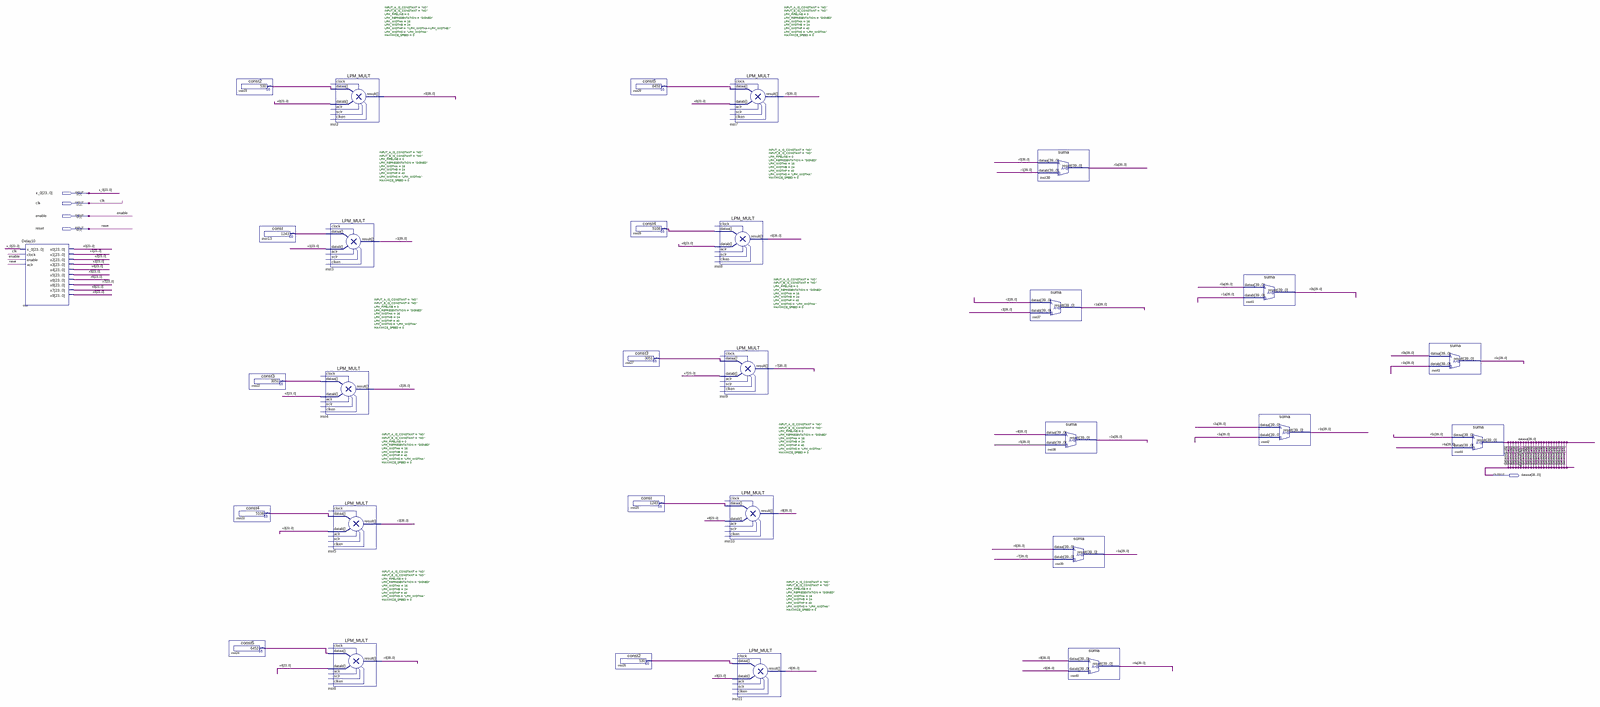
[diagram p0: schematic sheet, whole]
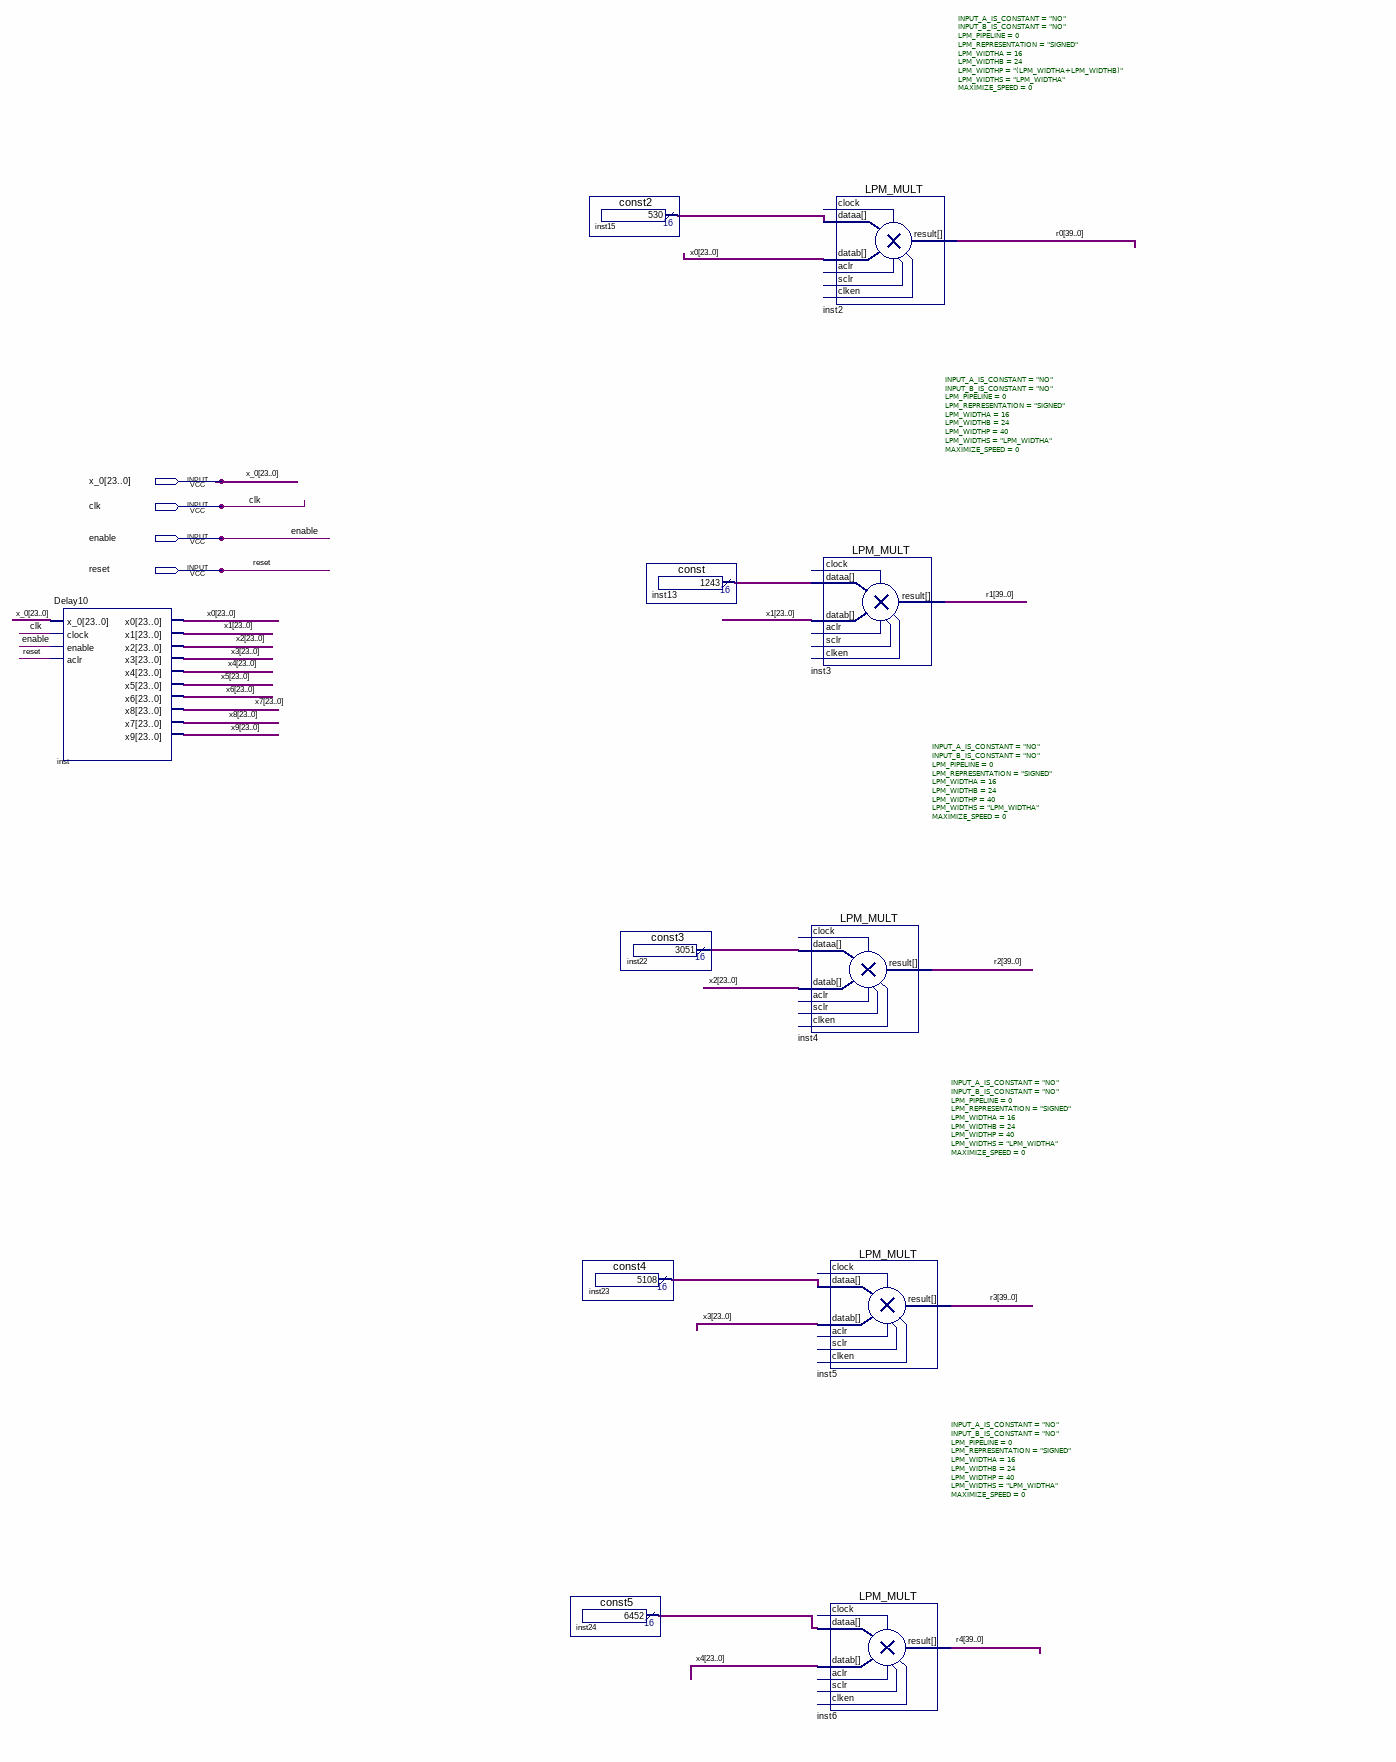
[diagram p1: schematic sheet, left part]
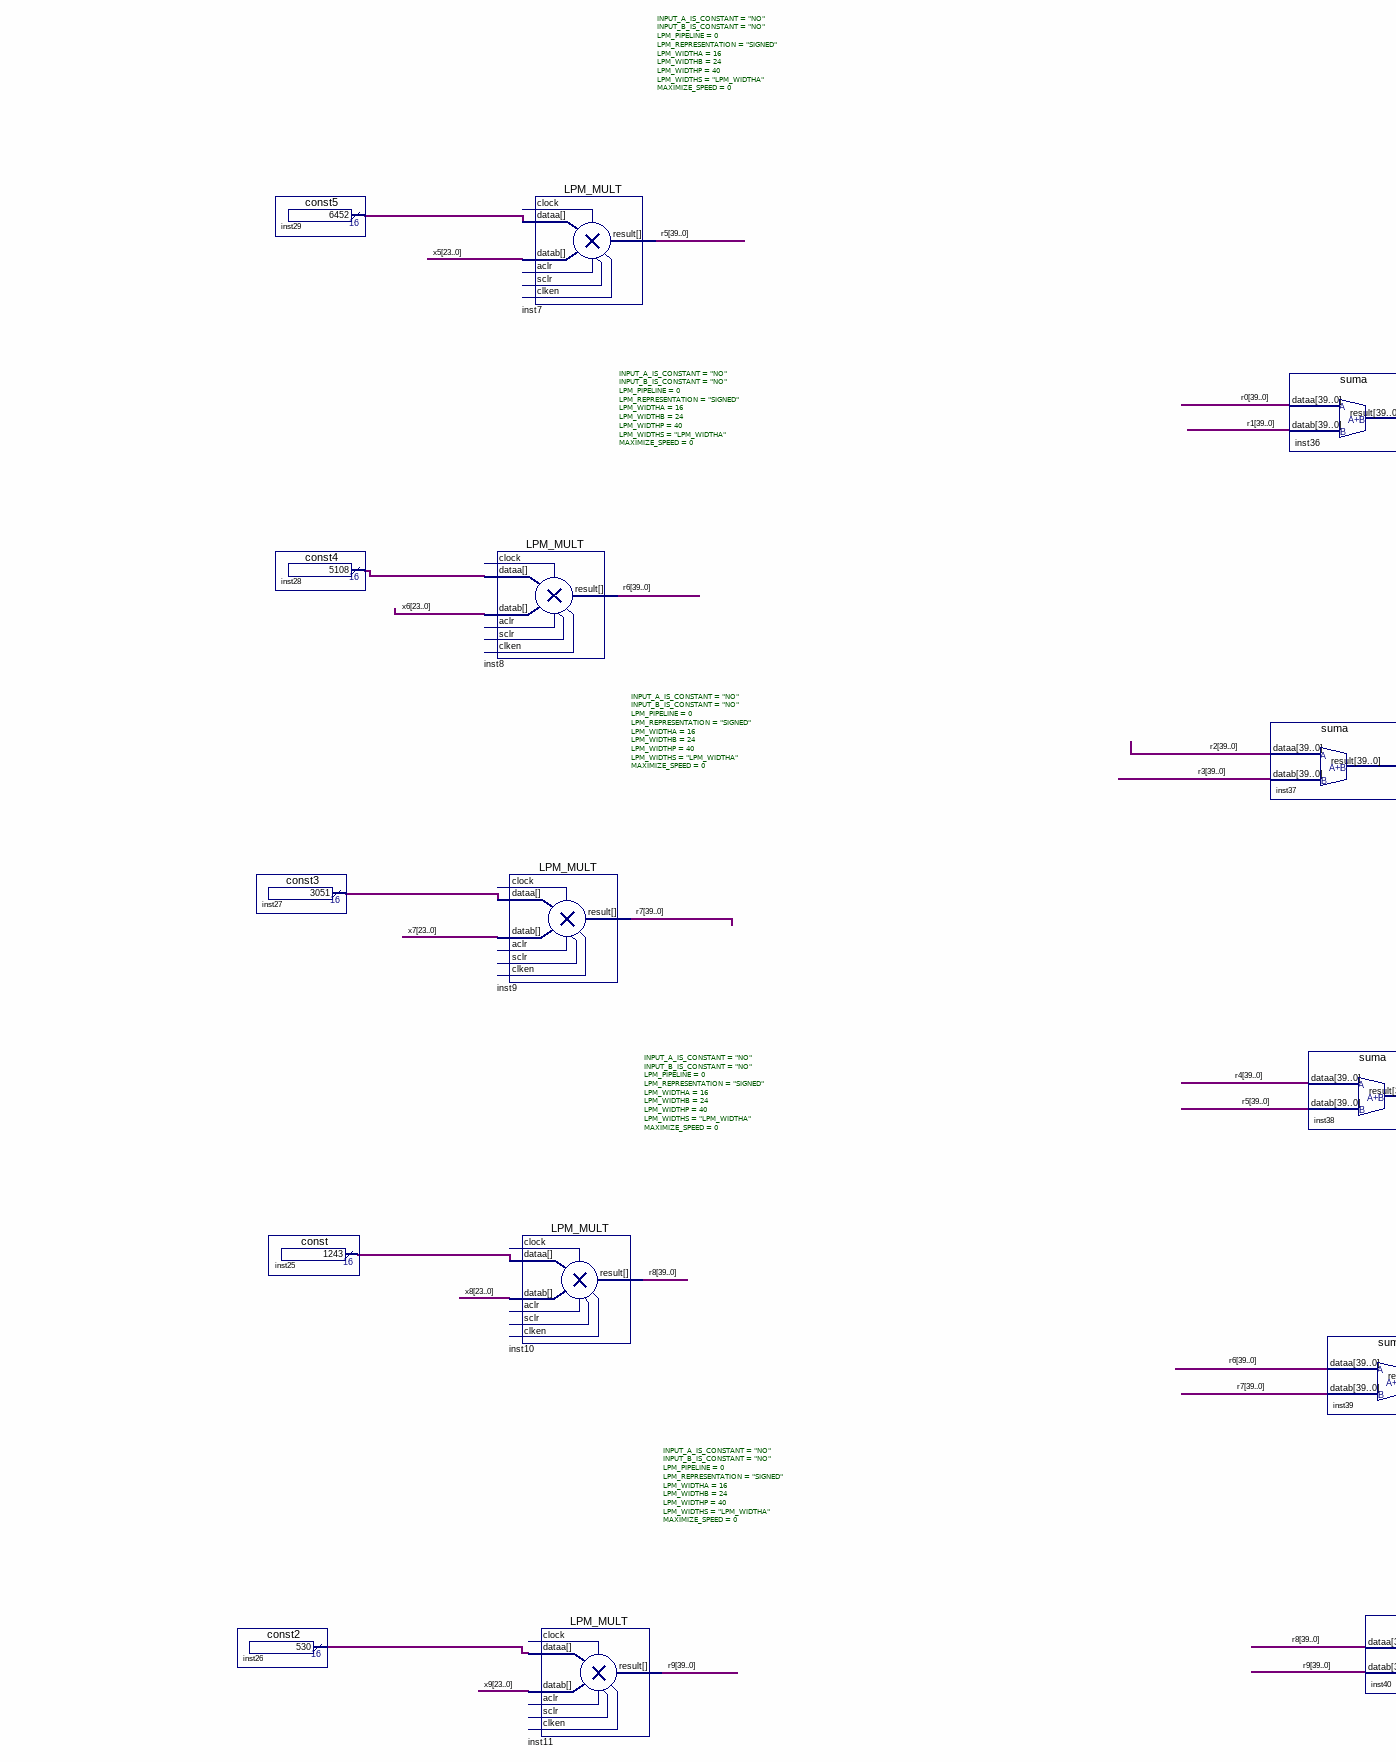
[diagram p2: schematic sheet, centre part]
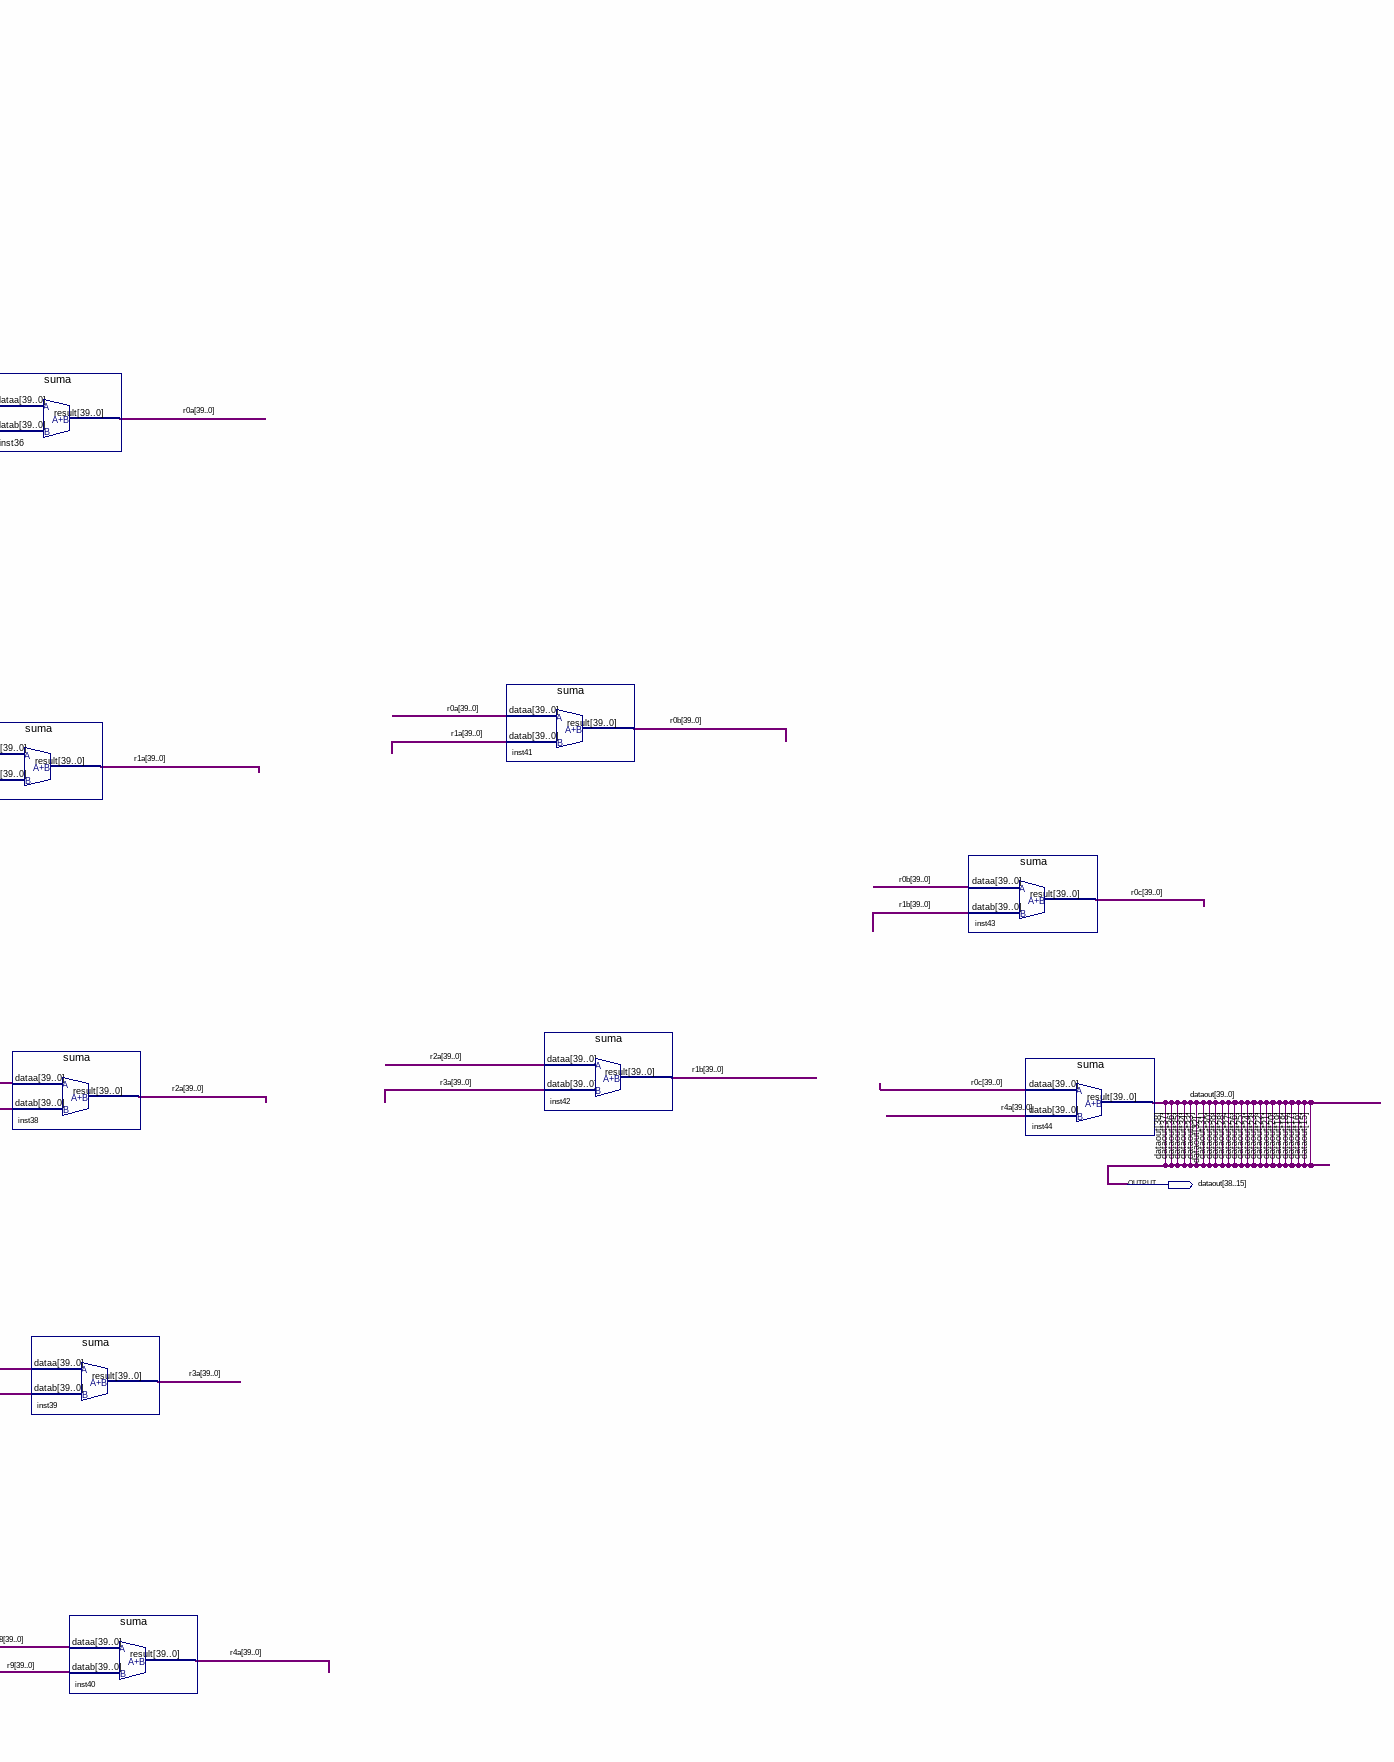
[diagram p3: schematic sheet, right part]
// Quartus schematic 10orderlowpassfilter.bdf as structural Verilog: 30 symbols, 5 pins
module \10orderlowpassfilter  (
  input  [23:0] x_0,
  input  clk,
  input  enable,
  input  reset,
  output [39:0] dataout
);

  wire [15:0] inst13_result, inst15_result, inst22_result, inst23_result, inst24_result, inst25_result,
       inst26_result, inst27_result, inst28_result, inst29_result;
  wire [23:0] x0, x1, x2, x3, x4, x5, x6, x7, x8, x9;
  wire [39:0] r0, r0a, r0b, r0c, r1, r1a, r1b, r2, r2a, r3, r3a, r4, r4a, r5, r6, r7, r8, r9;

  Delay10 inst (
    .x_0(x_0), .clock(clk), .enable(enable), .aclr(reset), .x0(x0), .x1(x1), .x2(x2), .x3(x3), .x4(x4),
    .x5(x5), .x6(x6), .x8(x7), .x7(x8), .x9(x9));
  const5 inst24 (.result(inst24_result));
  const2 inst15 (.result(inst15_result));
  const3 inst22 (.result(inst22_result));
  const4 inst23 (.result(inst23_result));
  \const  inst13 (.result(inst13_result));
  LPM_MULT #(.INPUT_A_IS_CONSTANT("NO"), .INPUT_B_IS_CONSTANT("NO"), .LPM_PIPELINE(0), .LPM_REPRESENTATION("SIGNED"), .LPM_WIDTHA(16), .LPM_WIDTHB(24), .LPM_WIDTHP("(LPM_WIDTHA+LPM_WIDTHB)"), .LPM_WIDTHS("LPM_WIDTHA"), .MAXIMIZE_SPEED(0)) inst2 (
    .dataa(inst15_result), .datab(x0), .result(r0));  // open: clock, aclr, sclr, clken
  LPM_MULT #(.INPUT_A_IS_CONSTANT("NO"), .INPUT_B_IS_CONSTANT("NO"), .LPM_PIPELINE(0), .LPM_REPRESENTATION("SIGNED"), .LPM_WIDTHA(16), .LPM_WIDTHB(24), .LPM_WIDTHP(40), .LPM_WIDTHS("LPM_WIDTHA"), .MAXIMIZE_SPEED(0)) inst3 (
    .dataa(inst13_result), .datab(x1), .result(r1));  // open: clock, aclr, sclr, clken
  LPM_MULT #(.INPUT_A_IS_CONSTANT("NO"), .INPUT_B_IS_CONSTANT("NO"), .LPM_PIPELINE(0), .LPM_REPRESENTATION("SIGNED"), .LPM_WIDTHA(16), .LPM_WIDTHB(24), .LPM_WIDTHP(40), .LPM_WIDTHS("LPM_WIDTHA"), .MAXIMIZE_SPEED(0)) inst4 (
    .dataa(inst22_result), .datab(x2), .result(r2));  // open: clock, aclr, sclr, clken
  LPM_MULT #(.INPUT_A_IS_CONSTANT("NO"), .INPUT_B_IS_CONSTANT("NO"), .LPM_PIPELINE(0), .LPM_REPRESENTATION("SIGNED"), .LPM_WIDTHA(16), .LPM_WIDTHB(24), .LPM_WIDTHP(40), .LPM_WIDTHS("LPM_WIDTHA"), .MAXIMIZE_SPEED(0)) inst5 (
    .dataa(inst23_result), .datab(x3), .result(r3));  // open: clock, aclr, sclr, clken
  LPM_MULT #(.INPUT_A_IS_CONSTANT("NO"), .INPUT_B_IS_CONSTANT("NO"), .LPM_PIPELINE(0), .LPM_REPRESENTATION("SIGNED"), .LPM_WIDTHA(16), .LPM_WIDTHB(24), .LPM_WIDTHP(40), .LPM_WIDTHS("LPM_WIDTHA"), .MAXIMIZE_SPEED(0)) inst6 (
    .dataa(inst24_result), .datab(x4), .result(r4));  // open: clock, aclr, sclr, clken
  const2 inst26 (.result(inst26_result));
  const5 inst29 (.result(inst29_result));
  const4 inst28 (.result(inst28_result));
  const3 inst27 (.result(inst27_result));
  \const  inst25 (.result(inst25_result));
  LPM_MULT #(.INPUT_A_IS_CONSTANT("NO"), .INPUT_B_IS_CONSTANT("NO"), .LPM_PIPELINE(0), .LPM_REPRESENTATION("SIGNED"), .LPM_WIDTHA(16), .LPM_WIDTHB(24), .LPM_WIDTHP(40), .LPM_WIDTHS("LPM_WIDTHA"), .MAXIMIZE_SPEED(0)) inst8 (
    .dataa(inst28_result), .datab(x6), .result(r6));  // open: clock, aclr, sclr, clken
  LPM_MULT #(.INPUT_A_IS_CONSTANT("NO"), .INPUT_B_IS_CONSTANT("NO"), .LPM_PIPELINE(0), .LPM_REPRESENTATION("SIGNED"), .LPM_WIDTHA(16), .LPM_WIDTHB(24), .LPM_WIDTHP(40), .LPM_WIDTHS("LPM_WIDTHA"), .MAXIMIZE_SPEED(0)) inst7 (
    .dataa(inst29_result), .datab(x5), .result(r5));  // open: clock, aclr, sclr, clken
  LPM_MULT #(.INPUT_A_IS_CONSTANT("NO"), .INPUT_B_IS_CONSTANT("NO"), .LPM_PIPELINE(0), .LPM_REPRESENTATION("SIGNED"), .LPM_WIDTHA(16), .LPM_WIDTHB(24), .LPM_WIDTHP(40), .LPM_WIDTHS("LPM_WIDTHA"), .MAXIMIZE_SPEED(0)) inst9 (
    .dataa(inst27_result), .datab(x7), .result(r7));  // open: clock, aclr, sclr, clken
  LPM_MULT #(.INPUT_A_IS_CONSTANT("NO"), .INPUT_B_IS_CONSTANT("NO"), .LPM_PIPELINE(0), .LPM_REPRESENTATION("SIGNED"), .LPM_WIDTHA(16), .LPM_WIDTHB(24), .LPM_WIDTHP(40), .LPM_WIDTHS("LPM_WIDTHA"), .MAXIMIZE_SPEED(0)) inst10 (
    .dataa(inst25_result), .datab(x8), .result(r8));  // open: clock, aclr, sclr, clken
  LPM_MULT #(.INPUT_A_IS_CONSTANT("NO"), .INPUT_B_IS_CONSTANT("NO"), .LPM_PIPELINE(0), .LPM_REPRESENTATION("SIGNED"), .LPM_WIDTHA(16), .LPM_WIDTHB(24), .LPM_WIDTHP(40), .LPM_WIDTHS("LPM_WIDTHA"), .MAXIMIZE_SPEED(0)) inst11 (
    .dataa(inst26_result), .datab(x9), .result(r9));  // open: clock, aclr, sclr, clken
  suma inst36 (.dataa(r0), .datab(r1), .result(r0a));
  suma inst37 (.dataa(r2), .datab(r3), .result(r1a));
  suma inst38 (.dataa(r4), .datab(r5), .result(r2a));
  suma inst39 (.dataa(r6), .datab(r7), .result(r3a));
  suma inst40 (.dataa(r8), .datab(r9), .result(r4a));
  suma inst41 (.dataa(r0a), .datab(r1a), .result(r0b));
  suma inst42 (.dataa(r2a), .datab(r3a), .result(r1b));
  suma inst43 (.dataa(r0b), .datab(r1b), .result(r0c));
  suma inst44 (.dataa(r0c), .datab(r4a), .result(dataout));
endmodule
